# EasyEDA Pro project main_board_shunts.epro

# Schematic Schematic5_1
Board Name: main_board_shunts; Create Date: 2025-07-20; Page Name: P1; Project Name: Aquiles; Schematic Name: Schematic5_1; Update Date: 2025-07-23; Company: Aquiles Corp; Page Size: A4; Version: V1.0
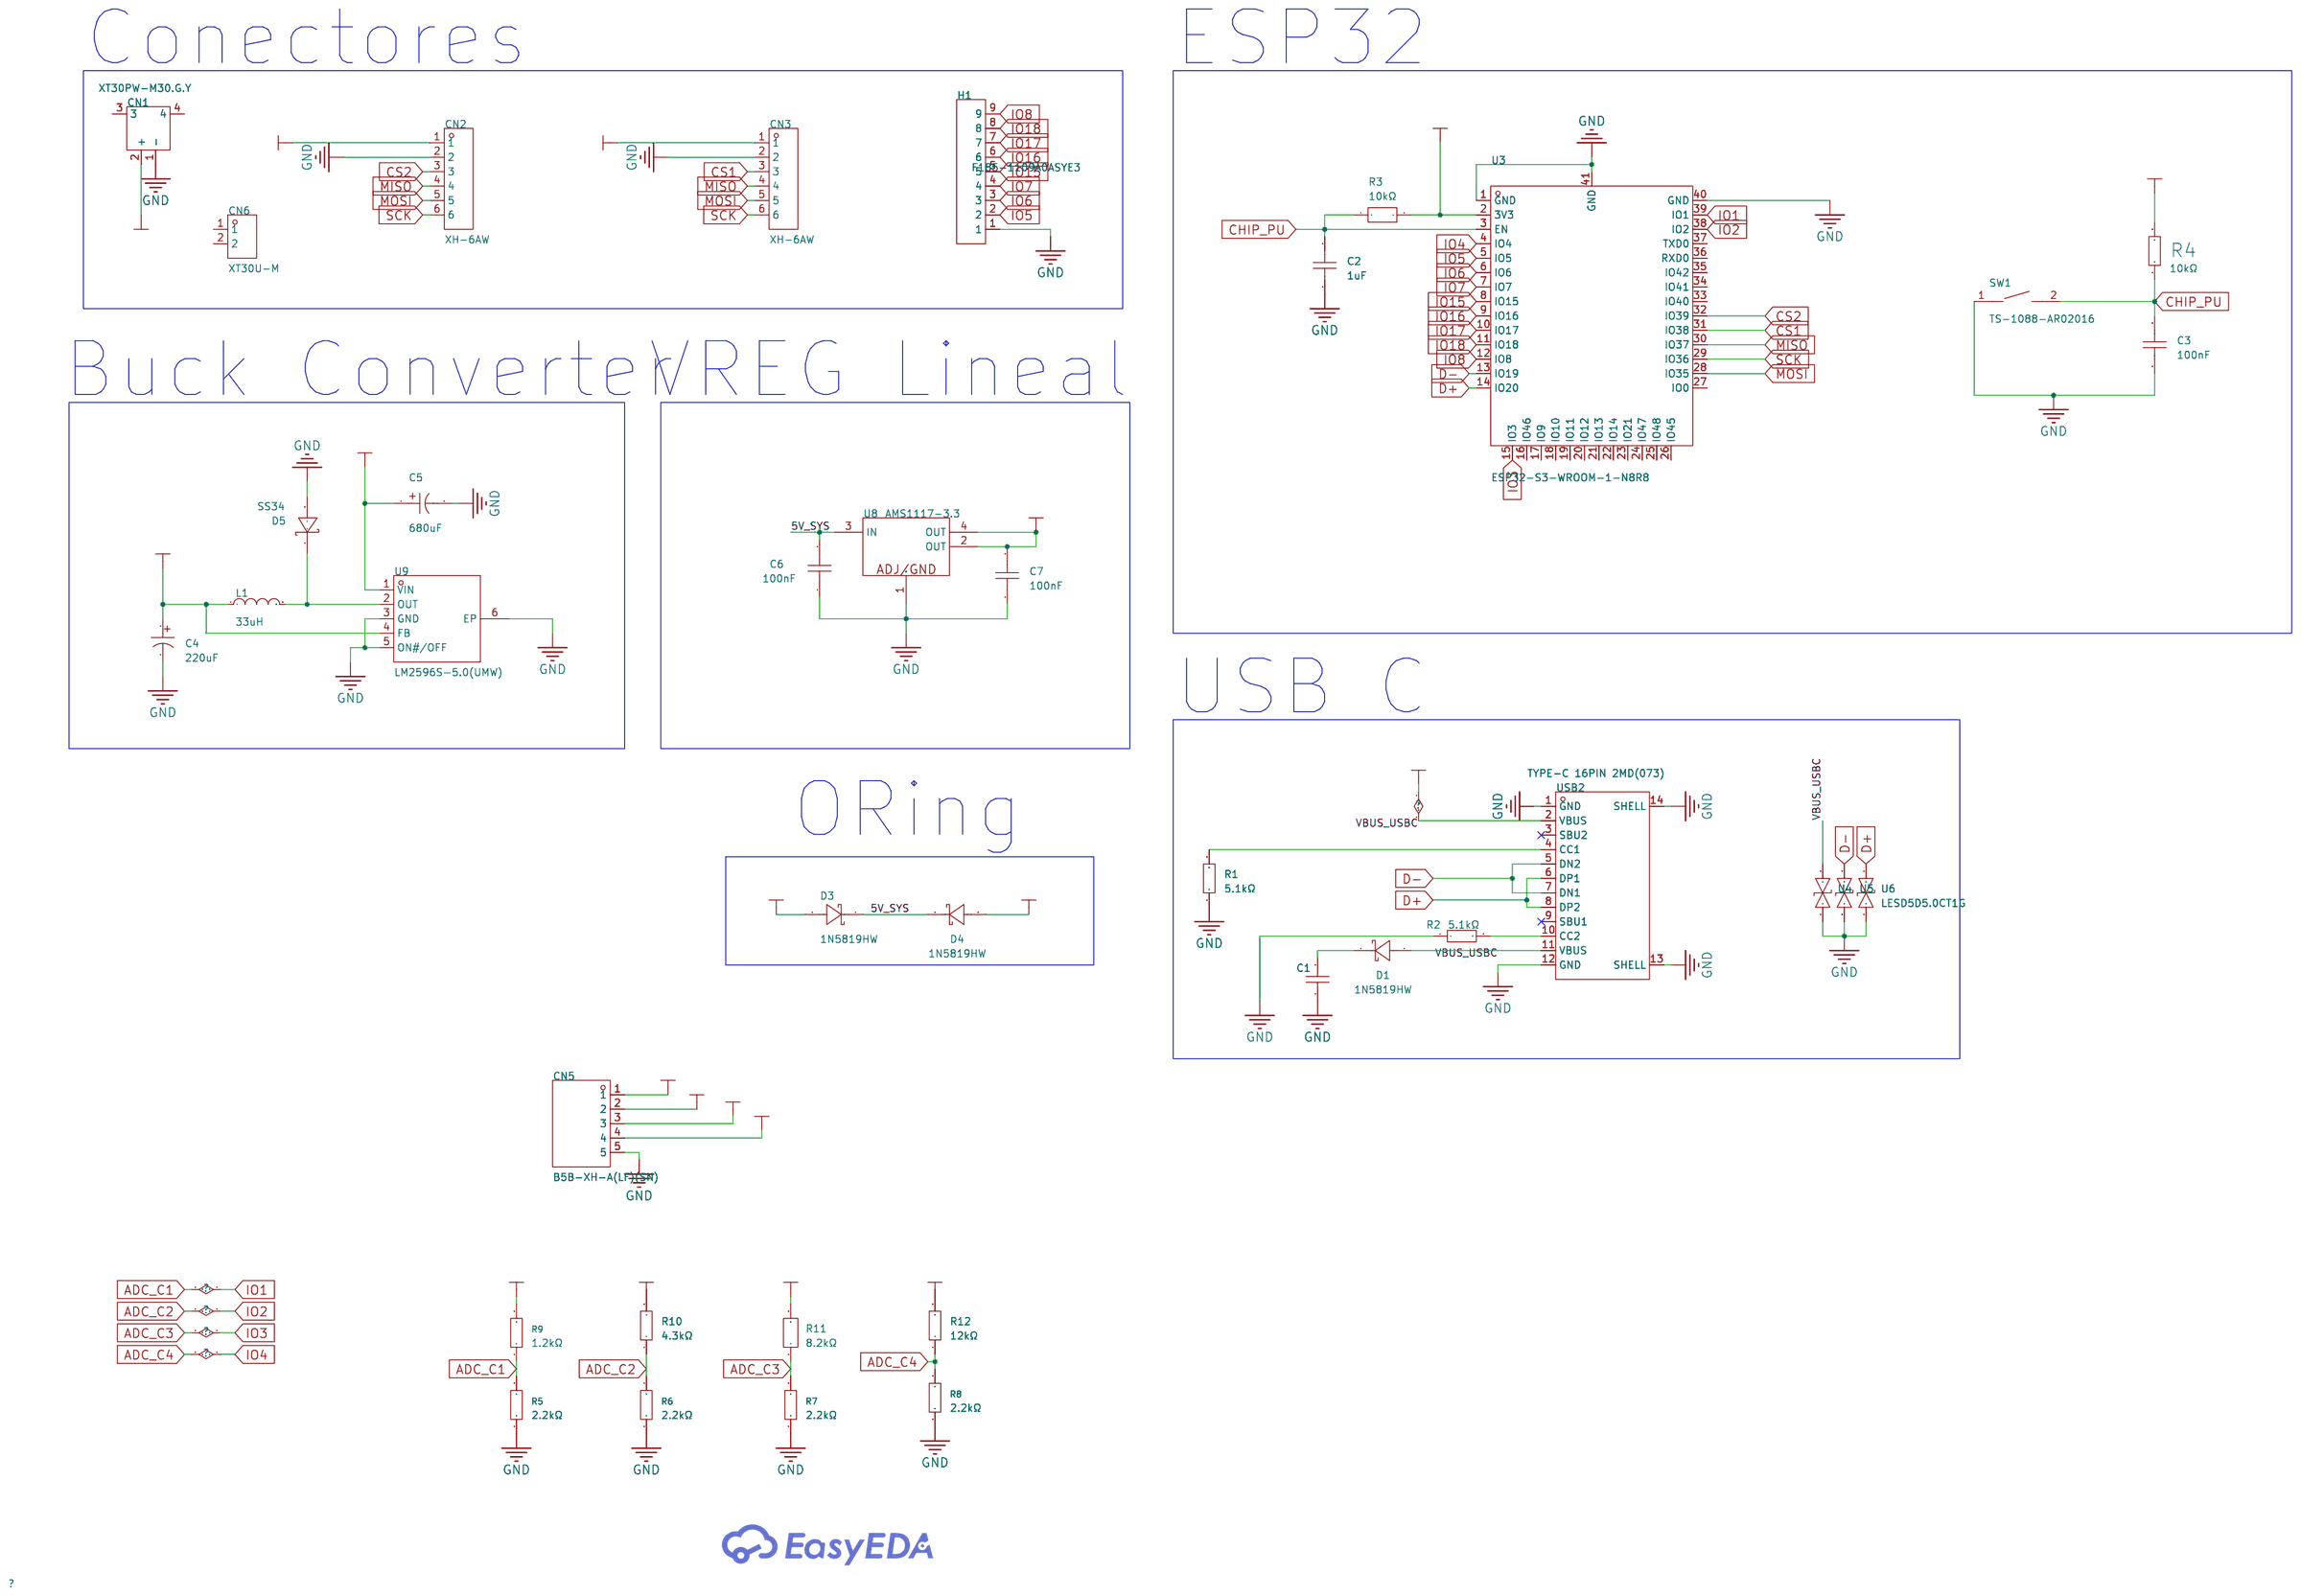
[diagram p0: schematic sheet]

## Parts
C1  10uF  [C0805]
C2  1uF  [C0603]
C3  100nF  [C0603]
C4  220uF  [CAP-SMD_BD6.3-L6.6-W6.6-FD]
C5  680uF  [CAP-SMD_BD6.3-L6.6-W6.6-LS7.0-FD]
C6  100nF  [C0805]
C7  100nF  [C0805]
CN1  XT30PW-M30.G.Y  [CONN-TH_XT30PW-M]
CN2  XH-6AW  [CONN-TH_6P-P2.54_HCTL_XH-6AW_C2908615]
CN3  XH-6AW  [CONN-TH_6P-P2.54_HCTL_XH-6AW_C2908615]
CN5  B5B-XH-A(LF)(SN)  [CONN-TH_B5B-XH-A-LF-SN]
CN6  XT30U-M  [CONN-TH_XT30U-M]
D1  1N5819HW  [SOD-123_L2.7-W1.6-LS3.8-RD]
D3  1N5819HW  [SOD-123_L2.7-W1.6-LS3.8-RD]
D4  1N5819HW  [SOD-123_L2.7-W1.6-LS3.8-RD]
D5  SS34  [SMA_L4.3-W2.6-LS5.2-RD]
H1  F185-1109A0ASYE3  [HDR-TH_9P-P2.54-V-F-1]
L1  33uH  [IND-SMD_L7.0-W6.6_FXL0650]
R1  5.1kΩ  [R0603]
R2  5.1kΩ  [R0603]
R3  10kΩ  [R0603]
R4  10kΩ  [R0603]
R5  2.2kΩ  [R0603]
R6  2.2kΩ  [R0603]
R7  2.2kΩ  [R0603]
R8  2.2kΩ  [R0603]
R9  1.2kΩ  [R0603]
R10  4.3kΩ  [R0603]
R11  8.2kΩ  [R0603]
R12  12kΩ  [R0603]
SW1  TS-1088-AR02016  [SW-SMD_L3.9-W3.0-P4.45]
U3  ESP32-S3-WROOM-1-N8R8  [WIRELM-SMD_ESP32-S3-WROOM-1]
U4  LESD5D5.0CT1G  [SOD-523_L1.2-W0.8-LS1.6-BI]
U5  LESD5D5.0CT1G  [SOD-523_L1.2-W0.8-LS1.6-BI]
U6  LESD5D5.0CT1G  [SOD-523_L1.2-W0.8-LS1.6-BI]
U8  AMS1117-3.3  [SOT-223-3_L6.4-W3.5-P2.30-LS7.0-BR]
U9  LM2596S-5.0(UMW)  [TO-263-5_L10.2-W8.9-P1.70-BR]
USB2  TYPE-C 16PIN 2MD(073)  [USB-C-SMD_TYPE-C-6PIN-2MD-073]

## Library data of the parts
C1 = CL21A106KOQNNNE: Capacitance: Tolerance:±10% Tolerance:±10% Voltage Rated: Temperature Coefficient:; LCSC Part Name: 10uF ±10% 16V; Supplier Part: C1713; Manufacturer: SAMSUNG(三星); Supplier Footprint: 0805; JLCPCB Part Class: Extended Part; Datasheet: https://atta.szlcsc.com/upload/public/pdf/source/20160218/1457707763339.pdf; Supplier: LCSC; Tolerance: ±10%
C2 = CL10A105KB8NNNC: Capacitance: Tolerance:±10% Tolerance:±10% Voltage Rated: Temperature Coefficient:; LCSC Part Name: 1uF ±10% 50V; Supplier Part: C15849; Manufacturer: SAMSUNG(三星); Supplier Footprint: 0603; JLCPCB Part Class: Basic Part; Datasheet: https://atta.szlcsc.com/upload/public/pdf/source/20160218/1457707763339.pdf; Supplier: LCSC; Tolerance: ±10%
C3 = CC0603KRX7R9BB104: Capacitance:100nF Tolerance:±10% Tolerance:±10% Voltage Rating:50V Temperature Coefficient:X7R; LCSC Part Name: 100nF ±10% 50V; Supplier Part: C14663; Manufacturer: YAGEO(国巨); Supplier Footprint: 0603; JLCPCB Part Class: Basic Part; Datasheet: https://atta.szlcsc.com/upload/public/pdf/source/20180910/C282072_33301C7F631E79921B82A8DAC6BCC5B3.pdf; Supplier: LCSC; Tolerance: ±10%; Voltage Rating: 50V; Temperature Coefficient: X7R
C4 = RVT1A221M0605_C72494: Capacitance:220uF Tolerance:±20% Tolerance:±20% Voltage Rating:10V Ripple Current:90mA@120Hz Equivalent Series Resistance(ESR):- Diameter:6.3mm Height - Seated (Max):5.4mm Lifetime:2000hrs@105℃ Operating Temperature:-40℃~+105℃ Operating Temperature:-40℃~+; LCSC Part Name: 220uF ±20% 10V; Supplier Part: C72494; Manufacturer: ROQANG(容强); Manufacturer Part: RVT1A221M0605; Supplier Footprint: SMD,D6.3xL5.4mm; JLCPCB Part Class: Extended Part; Datasheet: https://atta.szlcsc.com/upload/public/pdf/source/20170325/1490427950282.pdf; Supplier: LCSC; Tolerance: ±20%; Voltage Rating: 10V; Ripple Current: 90mA@120Hz; Diameter: 6.3mm; Height - Seated (Max): 5.4mm; Lifetime: 2000hrs@105℃; Operating Temperature: -40℃~+105℃
C5 = GVM0J687M0608CN: Capacitance:680uF Tolerance:±20% Tolerance:±20% Voltage Rating:6.3V Ripple Current:600mA@100kHz; LCSC Part Name: 680uF ±20% 6.3V; Supplier Part: C22383502; Manufacturer: ACMECON(鼎容); Supplier Footprint: SMD,D6.3xL7.7mm; JLCPCB Part Class: Extended Part; Datasheet: https://atta.szlcsc.com/upload/public/pdf/source/20240416/7BE02A688EFD4A45A978C00AE6AEA61D.pdf; Supplier: LCSC; Tolerance: ±20%; Voltage Rating: 6.3V; Ripple Current: 600mA@100kHz
C6 C7 = CC0805KRX7R9BB104: Capacitance: Tolerance:±10% Tolerance:±10% Voltage Rated: Temperature Coefficient:; LCSC Part Name: 100nF ±10% 50V; Supplier Part: C49678; Manufacturer: YAGEO(国巨); Supplier Footprint: 0805; JLCPCB Part Class: Basic Part; Datasheet: https://atta.szlcsc.com/upload/public/pdf/source/20180224/C181747_15194369449651363981.pdf; Supplier: LCSC; Tolerance: ±10%
CN1 = XT30PW-M30.G.Y: Power:- Output:- Input:- Size:- Interface:- Type:- Colour:- MaximumCurrent:- Type:Aviation model plug RatedVoltage:DC 500V Type1:- NumberOfUSBHoles:- InterfaceType:Male MetalMaterial:- InsulationMaterial:- RatedCurrent:15A RecommendedWireGauge:16/18/20AWG; LCSC Part Name: AMASS(艾迈斯)航模插头 卧式弯脚 XT30PW-M公头; Supplier Part: C431092; Manufacturer: AMASS(艾迈斯); JLCPCB Part Class: Extended Part; Datasheet: https://atta.szlcsc.com/upload/public/pdf/source/20220222/6A9F22F7850E25B33E1BE430ADF8560B.pdf; Supplier: LCSC; Type: Aviation model plug; RatedVoltage: DC 500V; InterfaceType: Male; RatedCurrent: 15A; RecommendedWireGauge: 16/18/20AWG; contact resistance: 1.2mΩ; specifications: 2pin
CN2 CN3 = XH-6AW: Pins Structure:1x6P Pitch:2.5mm Mounting Style:Right-Angle Reference Series:XH Number of Pins:6P Number of Rows:1 Number of PINs Per Row:6 Row Spacing:- Current Rating (Max):3A Contact Material:Brass Contact Plating:Tin Operating Temperature Range:-25℃~+8; LCSC Part Name: 1x6P 间距:2.5mm 弯插 系列:XH; Supplier Part: C2908615; Manufacturer: HCTL(华灿天禄); Supplier Footprint: 弯插,P=2.5mm; JLCPCB Part Class: Extended Part; Datasheet: https://atta.szlcsc.com/upload/public/pdf/source/20230711/B565BAF3B11666EF6B81B3605408F2BD.pdf; Supplier: LCSC; Pins Structure: 1x6P; Pitch: 2.5mm; Mounting Style: Right-Angle; Reference Series: XH; Number of Pins: 6P; Number of Rows: 1; Number of PINs Per Row: 6; Current Rating (Max): 3A; Contact Material: Brass; Contact Plating: Tin; Operating Temperature Range: -25℃~+85℃
CN5 = B5B-XH-A(LF)(SN): Pins Structure:1x5P Pitch:2.5mm Mounting Style:Direct Insert Reference Series:XH Number of Pins:5P Number of Rows:1 Number of PINs Per Row:5 Row Spacing:- Current Rating (Max):3A Contact Material:Brass Contact Plating:Tin Operating Temperature Range:-25℃~; LCSC Part Name: 1x5P 间距:2.5mm 直插 系列:XH; Supplier Part: C157991; Manufacturer: JST; Supplier Footprint: 插件,P=2.5mm; JLCPCB Part Class: Extended Part; Datasheet: https://atta.szlcsc.com/upload/public/pdf/source/20180928/C265283_F9DFEEBDB2CF642B6BDFAB4B77BD2680.pdf; Supplier: LCSC; Pins Structure: 1x5P; Pitch: 2.5mm; Mounting Style: Direct Insert; Reference Series: XH; Number of Pins: 5P; Number of Rows: 1; Number of PINs Per Row: 5; Current Rating (Max): 3A; Contact Material: Brass; Contact Plating: Tin; Operating Temperature Range: -25℃~+85℃; Rated Voltage (Max): 250V; Plastic Material: PA66; Flame Retardant Rating: UL94V-0; Supplementary Features: K-leg punch; Colour: White; Z-Height of the Board: 7mm; X-Length of Bottom Edge on Board (Spacing Line): 14.9mm; Y-Width of Bottom Edge on Board: 5.75mm
CN6 = XT30U-M: Power:- Output:- Input:- Size:- Interface:- Type:- Colour:Yellow MaximumCurrent:- Type:Plug RatedVoltage:- Type1:- NumberOfUSBHoles:- InterfaceType:Male MetalMaterial:- InsulationMaterial:- RatedCurrent:- RecommendedWireGauge:- FlameRetardantGrade:- conta; LCSC Part Name: AMASS(艾迈斯)轻量版锂电池插头公头 XT30U-M; Supplier Part: C99101; Manufacturer: AMASS(艾迈斯); JLCPCB Part Class: Extended Part; Datasheet: https://atta.szlcsc.com/upload/public/pdf/source/20170606/1496716542582.pdf; Supplier: LCSC; Type: Plug; Colour: Yellow; InterfaceType: Male
D1 D3 D4 = 1N5819HW_C41431974: Voltage - Forward(Vf@If):0.58V@1.0A Voltage - DC Reverse(Vr):40V Current - Rectified:1A Reverse Leakage Current (Ir):50uA@40V; Supplier Part: C41431974; Manufacturer: GOODWORK(固得沃克); Supplier Footprint: SOD-123; JLCPCB Part Class: Extended Part; Datasheet: https://atta.szlcsc.com/upload/public/pdf/source/20241016/F9575ED4EB339D9C6D56946D8A9F6336.pdf; Supplier: LCSC; Voltage - Forward(Vf@If): 0.58V@1.0A; Voltage - DC Reverse(Vr): 40V; Current - Rectified: 1A; Reverse Leakage Current (Ir): 50uA@40V
D5 = SS34_C8678: Diode Configuration:Independent Type Forward Voltage (Vf@If):550mV@3A Reverse Voltage (Vr):40V Rectified Current:3A Reverse Leakage Current (Ir):500uA@40V; LCSC Part Name: 电压:40V 电流:3A; Supplier Part: C8678; Manufacturer: MDD(辰达半导体); Supplier Footprint: SMA(DO-214AC); JLCPCB Part Class: Basic Part; Datasheet: https://atta.szlcsc.com/upload/public/pdf/source/20240710/2118BB86FDDB2E0B294389AC1F3F65C8.pdf; Supplier: LCSC; Diode Configuration: Independent Type; Forward Voltage (Vf@If): 550mV@3A; Reverse Voltage (Vr): 40V; Rectified Current: 3A; Reverse Leakage Current (Ir): 500uA@40V
H1 = F185-1109A0ASYE3: Holes Structure:1x9P Pitch:2.54mm Mounting Type:Straight Number of Rows:Single Row Number of Positions:9P Insulation Height:8.5mm Contact Material:Brass; LCSC Part Name: 1x9P 间距:2.54mm 直插; Supplier Part: C7494789; Manufacturer: Yxcon(宇熙精密); Supplier Footprint: 插件,P=2.54mm; JLCPCB Part Class: Extended Part; Supplier: LCSC; Holes Structure: 1x9P; Pitch: 2.54mm; Mounting Type: Straight; Number of Rows: Single Row; Number of Positions: 9P; Insulation Height: 8.5mm; Contact Material: Brass
L1 = FXL0650-330-M: Inductance: Tolerance:±20% Tolerance:±20% Rated Current: Saturation Current (Isat):3A DC Resistance (DCR): Type:Integrated molded inductor; LCSC Part Name: 33uH ±20% 3A; Supplier Part: C475526; Manufacturer: cjiang(长江微电); Supplier Footprint: SMD,6.6x7mm; JLCPCB Part Class: Extended Part; Datasheet: https://atta.szlcsc.com/upload/public/pdf/source/20240426/3189EA8206330E2108542F9E34E540E7.pdf; Supplier: LCSC; Tolerance: ±20%; Saturation Current (Isat): 3A; Type: Integrated molded inductor
R1 R2 = 0603WAF5101T5E: Type:Thick Film Resistors Resistance:5.1kΩ Tolerance:±1% Tolerance:±1% Power(Watts): Overload Voltage (Max): Temperature Coefficient:±100ppm/℃ Temperature Coefficient:±100ppm/℃ Operating Temperature Range:-55℃~+155℃ Operating Temperature Range:-55℃~+155℃; LCSC Part Name: 5.1kΩ ±1% 100mW 厚膜电阻; Supplier Part: C23186; Manufacturer: UNI-ROYAL(厚声); Supplier Footprint: 0603; JLCPCB Part Class: Basic Part; Datasheet: https://atta.szlcsc.com/upload/public/pdf/source/20200306/C422600_1E6D84923E4A46A82E41ADD87F860B5C.pdf; Supplier: LCSC; Type: Thick Film Resistors; Tolerance: ±1%; Temperature Coefficient: ±100ppm/℃; Operating Temperature Range: -55℃~+155℃
R3 = SCR0603J10K: Type:Thick Film Resistors Resistance: Tolerance:±5% Tolerance:±5% Power(Watts): Overload Voltage (Max): Operating Temperature Range:-55℃~+155℃ Operating Temperature Range:-55℃~+155℃; LCSC Part Name: 厚膜电阻 10kΩ ±5% 100mW; Supplier Part: C3017715; Manufacturer: VO(翔胜); Supplier Footprint: 0603; JLCPCB Part Class: Extended Part; Datasheet: https://atta.szlcsc.com/upload/public/pdf/source/20220513/247AF9639BA21CF93567DC289CCC6A22.pdf; Supplier: LCSC; Type: Thick Film Resistors; Tolerance: ±5%; Operating Temperature Range: -55℃~+155℃
R4 = 0603WAF1002T5E: Type:Thick Film Resistor Resistance:10kΩ Tolerance:±1% Tolerance:±1% Power(Watts):100mW Voltage-Supply(Max):75V Temperature Coefficient:±100ppm/℃ Temperature Coefficient:±100ppm/℃ Operating Temperature:-55℃~+155℃ Operating Temperature:-55℃~+155℃; LCSC Part Name: 厚膜电阻 10kΩ ±1% 100mW; Supplier Part: C25804; Manufacturer: UNI-ROYAL(厚声); Supplier Footprint: 0603; JLCPCB Part Class: Basic Part; Datasheet: https://atta.szlcsc.com/upload/public/pdf/source/20200306/C422600_1E6D84923E4A46A82E41ADD87F860B5C.pdf; Supplier: LCSC; Type: Thick Film Resistor; Tolerance: ±1%; Power(Watts): 100mW; Voltage-Supply(Max): 75V; Temperature Coefficient: ±100ppm/℃; Operating Temperature: -55℃~+155℃
R5-R8 = RMC06032.2K1%N: Resistance:2.2kΩ Tolerance:±1% Tolerance:±1% Power(Watts):0.1W; LCSC Part Name: 2.2kΩ ±1% 100mW; Supplier Part: C325591; Manufacturer: Tyohm(幸亚电阻); Supplier Footprint: 0603; JLCPCB Part Class: Extended Part; Datasheet: https://atta.szlcsc.com/upload/public/pdf/source/20190115/C325956_D27151D492FFB3C9AB4A6F14FE01F30A.pdf; Supplier: LCSC; Tolerance: ±1%; Power(Watts): 0.1W
R9 = RMC06031.2K5%N: Resistance: Tolerance:±5% Tolerance:±5% Power(Watts):; LCSC Part Name: 1.2kΩ ±5% 100mW; Supplier Part: C269681; Manufacturer: Tyohm(幸亚电阻); Supplier Footprint: 0603; JLCPCB Part Class: Extended Part; Datasheet: https://atta.szlcsc.com/upload/public/pdf/source/20190115/C325956_D27151D492FFB3C9AB4A6F14FE01F30A.pdf; Supplier: LCSC; Tolerance: ±5%
R10 = 0603WAF4301T5E: Type:Thick Film Resistors Resistance:4.3kΩ Tolerance:±1% Tolerance:±1% Power(Watts): Overload Voltage (Max): Temperature Coefficient:±100ppm/℃ Temperature Coefficient:±100ppm/℃ Operating Temperature Range:-55℃~+155℃ Operating Temperature Range:-55℃~+155℃; LCSC Part Name: 4.3kΩ ±1% 100mW 厚膜电阻; Supplier Part: C23159; Manufacturer: UNI-ROYAL(厚声); Supplier Footprint: 0603; JLCPCB Part Class: Extended Part; Datasheet: https://atta.szlcsc.com/upload/public/pdf/source/20200306/C422600_1E6D84923E4A46A82E41ADD87F860B5C.pdf; Supplier: LCSC; Type: Thick Film Resistors; Tolerance: ±1%; Temperature Coefficient: ±100ppm/℃; Operating Temperature Range: -55℃~+155℃
R11 = FRC0603F8201TS: Type:Thick Film Resistors Resistance:8.2kΩ Tolerance:±1% Tolerance:±1% Power(Watts): Voltage-Supply(Max): Temperature Coefficient:±100ppm/℃ Temperature Coefficient:±100ppm/℃ Operating Temperature:-55℃~+155℃ Operating Temperature:-55℃~+155℃; LCSC Part Name: 8.2kΩ ±1% 100mW 厚膜电阻; Supplier Part: C2907069; Manufacturer: FOJAN(富捷); Supplier Footprint: 0603; JLCPCB Part Class: Extended Part; Datasheet: https://atta.szlcsc.com/upload/public/pdf/source/20211221/925EC7D7225764EE0046F22065062C87.pdf; Supplier: LCSC; Type: Thick Film Resistors; Tolerance: ±1%; Temperature Coefficient: ±100ppm/℃; Operating Temperature: -55℃~+155℃
R12 = 0603WAF1202T5E: Type:Thick Film Resistors Resistance:12kΩ Tolerance:±1% Tolerance:±1% Power(Watts): Overload Voltage (Max): Temperature Coefficient:±100ppm/℃ Temperature Coefficient:±100ppm/℃ Operating Temperature Range:-55℃~+155℃ Operating Temperature Range:-55℃~+155℃; LCSC Part Name: 12kΩ ±1% 100mW 厚膜电阻; Supplier Part: C22790; Manufacturer: UNI-ROYAL(厚声); Supplier Footprint: 0603; JLCPCB Part Class: Basic Part; Datasheet: https://atta.szlcsc.com/upload/public/pdf/source/20200306/C422600_1E6D84923E4A46A82E41ADD87F860B5C.pdf; Supplier: LCSC; Type: Thick Film Resistors; Tolerance: ±1%; Temperature Coefficient: ±100ppm/℃; Operating Temperature Range: -55℃~+155℃
SW1 = TS-1088-AR02016: Circuit:SPST Actuator Style:Round Button Operating Force:160gf Mounting Style:Brick nogging Switch Length:4mm Switch Width:3mm Switch Height:2mm Strike Gundam:不带 Contact Current:50mA Voltage Rating (DC):12V Insulation Resistance:100MΩ Actuator/Cap Color:B; LCSC Part Name: 4*3*2mm 立贴 轻触开关; Supplier Part: C720477; Manufacturer: XUNPU(讯普); Supplier Footprint: SMD; JLCPCB Part Class: Basic Part; Datasheet: https://atta.szlcsc.com/upload/public/pdf/source/20200810/C720475_60D09DD6C54279ADDB2DC25100F1CC11.pdf; Supplier: LCSC; Circuit: SPST; Actuator Style: Round Button; Operating Force: 160gf; Mounting Style: Brick nogging; Switch Length: 4mm; Switch Width: 3mm; Switch Height: 2mm; Strike Gundam: 不带; Contact Current: 50mA; Voltage Rating (DC): 12V; Insulation Resistance: 100MΩ; Actuator/Cap Color: Black; Pin Style: SMDSplicing; Mechanical Life: 10万次; Operating Temperature: -30℃~+80℃
U3 = ESP32-S3-WROOM-1-N8R8: Supplier Part: C2913201; Manufacturer: ESPRESSIF(乐鑫); Supplier Footprint: SMD,25.5x18mm; JLCPCB Part Class: Extended Part; Datasheet: https://atta.szlcsc.com/upload/public/pdf/source/20241030/6A412B13087E1327DF6279F5735253CA.pdf; Supplier: LCSC
U4-U6 = LESD5D5.0CT1G_C5246195: Supplier Part: C5246195; Manufacturer: Leiditech(雷卯电子); Supplier Footprint: SOD-523; JLCPCB Part Class: Extended Part; Datasheet: https://atta.szlcsc.com/upload/public/pdf/source/20221108/1C42B36F7D16189BC2911DA9C8277455.pdf; Supplier: LCSC
U8 = AMS1117-3.3: Output Type:Fixed Voltage - Supply:15V Output Voltage:3.3V Output Voltage:3.3V Output Current:1A Power Supply Rejection Ratio (PSRR):- Features:Overcurrent Protection(OCP) Operating Temperature:-40℃~+125℃ Operating Temperature:-40℃~+125℃ Output Configurat; Supplier Part: C2992570; Manufacturer: 国芯佳品; Supplier Footprint: SOT-223-3; JLCPCB Part Class: Extended Part; Datasheet: https://atta.szlcsc.com/upload/public/pdf/source/20220729/0D21C21EC310E4778671BF6BAE438640.pdf; Supplier: LCSC; Output Type: Fixed; Voltage - Supply: 15V; Output Voltage: 3.3V; Output Current: 1A; Features: Overcurrent Protection(OCP); Operating Temperature: -40℃~+125℃; Output Configuration: Positive electrode; Number of Outputs: 1
U9 = LM2596S-5.0(UMW): Function:Step-down type Output Type:Fixed Input Voltage:7V~40V Input Voltage:7V~40V Output Voltage:5V Output Voltage:5V Output Current:3A Switching Frequency:150kHz Switching Frequency:150kHz Operating Temperature:-40℃~+125℃@(TA) Operating Temperature:-40; LCSC Part Name: 3A降压稳压器; Supplier Part: C347421; Manufacturer: UMW(友台半导体); Supplier Footprint: TO-263-5; JLCPCB Part Class: Extended Part; Datasheet: https://atta.szlcsc.com/upload/public/pdf/source/20241113/7515F50B4FEE0270D4DE7078364C87FA.pdf; Supplier: LCSC; Function: Step-down type; Output Type: Fixed; Input Voltage: 7V~40V; Output Voltage: 5V; Output Current: 3A; Switching Frequency: 150kHz; Operating Temperature: -40℃~+125℃@(TA); Synchronous Rectification: No; Number of Outputs: 1; Topology: Step-down; Quiescent Current (Iq): 80uA; Switch tube (built-in/external): Built-in
USB2 = TYPE-C 16PIN 2MD(073): Connector Type:Type-C Protocol Standard:USB 3.1 Gender:Female Mounting Type:Surface Mount, Right Angle Number of Contacts:16P Number of Ports:1 Current Rating-Power:3A Voltage Rating:5V Connect-Disconnect Life:5,000 Cycles Supplementary Features:- Center; LCSC Part Name: Type-C 母 卧贴; Supplier Part: C2765186; Manufacturer: SHOU HAN(首韩); Supplier Footprint: SMD; JLCPCB Part Class: Extended Part; Datasheet: https://atta.szlcsc.com/upload/public/pdf/source/20250506/FFB74EDFDFA0AC372CE4A8E4F739CCEF.pdf; Supplier: LCSC; Connector Type: Type-C; Protocol Standard: USB 3.1; Gender: Female; Mounting Type: Surface Mount, Right Angle; Number of Contacts: 16P; Number of Ports: 1; Current Rating-Power: 3A; Voltage Rating: 5V; Connect-Disconnect Life: 5,000 Cycles; Detection color: Black; Operating Temperature: -25℃~+85℃

## Nets
5V_REG: C4.1 CN2.1 CN3.1 D3.2(A) L1.1 U9.4(FB)
5V_SYS: C6.2 D3.1(C) D4.1(C) U8.3(IN)
5V_USB: D1.2(A) D4.2(A) U4.2 USB2.2(VBUS) USB2.11(VBUS)
GND: C1.1 C2.1 C3.1 C4.2 C5.2 C6.1 C7.1 CN1.1(-) CN2.2 CN3.2 CN5.5 D5.2(A) H1.1 R1.1 R2.1 R5.1 R6.1 R7.1 R8.1 SW1.1 U3.1(GND) U3.40(GND) U3.41(GND) U4.1 U5.1 U6.1 U8.1(ADJ/GND) U9.3(GND) U9.5(ON#/OFF) U9.6(EP) USB2.1(GND) USB2.12(GND) USB2.13(SHELL) USB2.14(SHELL)
ADC_C1: R5.2 R9.1 U3.39(IO1)
ADC_C2: R6.2 R10.1 U3.38(IO2)
ADC_C3: R7.2 R11.1 U3.15(IO3)
ADC_C4: R8.2 R12.1 U3.4(IO4)
CHIP_PU: C2.2 C3.2 R3.1 R4.1 SW1.2 U3.3(EN)
CS1: CN3.3 U3.31(IO38)
CS2: CN2.3 U3.32(IO39)
D+: U3.14(IO20) U6.2 USB2.6(DP1) USB2.8(DP2)
D-: U3.13(IO19) U5.2 USB2.5(DN2) USB2.7(DN1)
IO5: H1.2 U3.5(IO5)
IO6: H1.3 U3.6(IO6)
IO7: H1.4 U3.7(IO7)
IO8: H1.9 U3.12(IO8)
IO15: H1.5 U3.8(IO15)
IO16: H1.6 U3.9(IO16)
IO17: H1.7 U3.10(IO17)
IO18: H1.8 U3.11(IO18)
MISO: CN2.4 CN3.4 U3.30(IO37)
MOSI: CN2.5 CN3.5 U3.28(IO35)
PWR_VCC: C5.1 CN1.2(+) U9.1(VIN)
SCK: CN2.6 CN3.6 U3.29(IO36)
V_C1: CN5.4 R9.2
V_C2: CN5.3 R10.2
V_C3: CN5.2 R11.2
V_C4: CN5.1 R12.2
VSYS: C7.2 R3.2 R4.2 U3.2(3V3) U8.2(OUT) U8.4(OUT)
$1N3095: R1.2 USB2.4(CC1)
$1N3333: C1.2 D1.1(C)
$1N3491: R2.2 USB2.10(CC2)
$1N7879: D5.1(K) L1.2 U9.2(OUT)

Not connected (* = marked no-connect by the designer): CN1 3 4; CN6 1 2; U3 16(IO46) 17(IO9) 18(IO10) 19(IO11) 20(IO12) 21(IO13) 22(IO14) 23(IO21) 24(IO47) 25(IO48) 26(IO45) 27(IO0) 33(IO40) 34(IO41) 35(IO42) 36(RXD0) 37(TXD0); USB2 3(SBU2)* 9(SBU1)*

## Notes on the sheet
- Conectores
- ESP32
- Buck Converter
- VREG Lineal
- USB C
- ORing

# Board PCB7_1
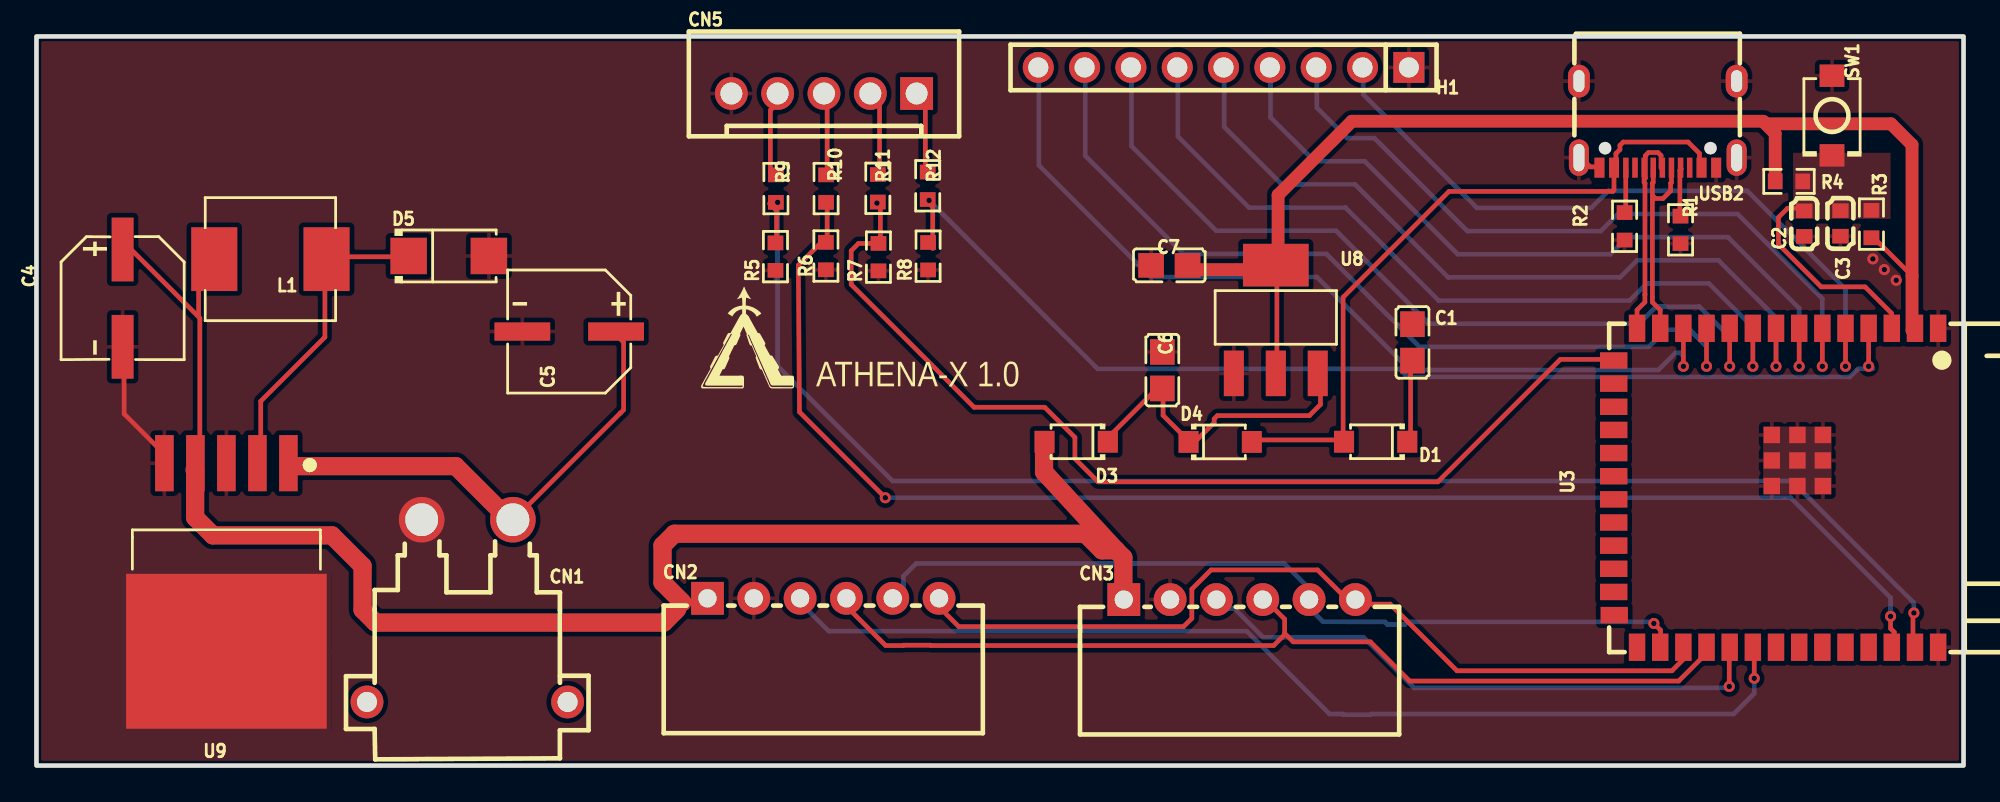
[diagram p1: board, top side]
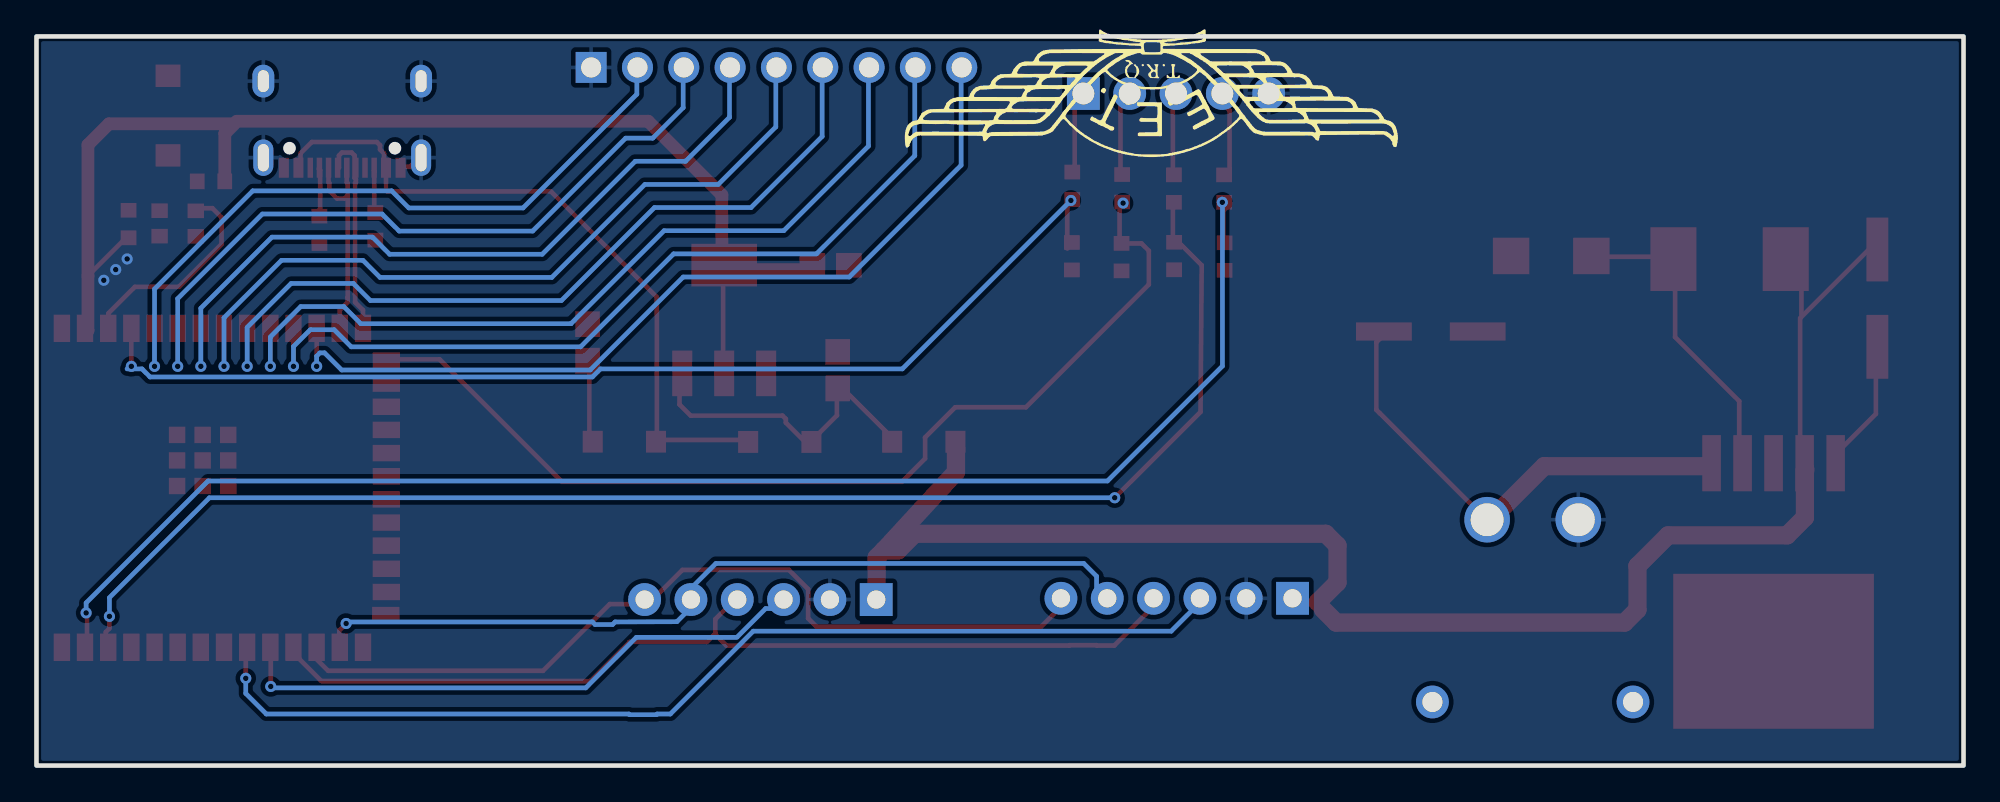
[diagram p2: board, bottom side, seen from below]

Outline 105.66 x 40 mm; copper layers: Top Layer, Bottom Layer. Coordinates in mm from the lower left corner of the outline.
Outline path: rectangle 0,40 105.66,0
Stack: Top Layer 0.035mm / Dielectric1 1.51mm FR4 er 4.5 / Bottom Layer 0.035mm

## Design rules (mm)
net D-: DP1
net D+: DP1
template: JLCPCB Capability(Two Layers Board)
spacing copperThickness1oz (default): track to track 0.102, other pairs 0.152 to 0.3
spacing copperThickness2oz: track to track 0.203, other pairs 0.152 to 0.3
track width copperThickness1oz (default): min 0.127, default 0.254, max 2.54
track width copperThickness2oz: min 0.203, default 0.254, max 2.54
differential pair differentialPair (default): width min 0.127, default 0.254, max 2.54; gap min 0.152, default 0.152
via viaSize (default): diameter min 0.5, default 0.61, max 10; hole min 0.3, default 0.305, max 6.3

## Placement (name value [footprint] x y rotation side)
C1  10uF  [C0805]  75.45 23.22 270 top
C2  1uF  [C0603]  96.93 29.74 90 top
C3  100nF  [C0603]  98.91 29.75 90 top
C4  220uF  [CAP-SMD_BD6.3-L6.6-W6.6-FD]  4.72 25.65 270 top
C5  680uF  [CAP-SMD_BD6.3-L6.6-W6.6-LS7.0-FD]  29.21 23.81 180 top
C6  100nF  [C0805]  61.73 21.69 270 top
C7  100nF  [C0805]  62.12 27.45 0 top
CN1  XT30PW-M30.G.Y  [CONN-TH_XT30PW-M]  23.62 8.49 0 top
CN2  XH-6AW  [CONN-TH_6P-P2.54_HCTL_XH-6AW_C2908615]  43.14 9.18 0 top
CN3  XH-6AW  [CONN-TH_6P-P2.54_HCTL_XH-6AW_C2908615]  65.97 9.11 0 top
CN5  B5B-XH-A(LF)(SN)  [CONN-TH_B5B-XH-A-LF-SN]  43.18 36.88 0 top
D1  1N5819HW  [SOD-123_L2.7-W1.6-LS3.8-RD]  73.43 17.77 180 top
D3  1N5819HW  [SOD-123_L2.7-W1.6-LS3.8-RD]  57.01 17.76 180 top
D4  1N5819HW  [SOD-123_L2.7-W1.6-LS3.8-RD]  64.91 17.76 0 top
D5  SS34  [SMA_L4.3-W2.6-LS5.2-RD]  22.61 27.96 0 top
H1  F185-1109A0ASYE3  [HDR-TH_9P-P2.54-V-F-1]  65.09 38.3 180 top
L1  33uH  [IND-SMD_L7.0-W6.6_FXL0650]  12.83 27.79 180 top
R1  5.1kΩ  [R0603]  90.15 29.39 90 top
R2  5.1kΩ  [R0603]  87.08 29.59 90 top
R3  10kΩ  [R0603]  100.61 29.71 270 top
R4  10kΩ  [R0603]  96.09 32.05 180 top
R5  2.2kΩ  [R0603]  40.52 27.92 90 top
R6  2.2kΩ  [R0603]  43.29 27.96 90 top
R7  2.2kΩ  [R0603]  46.17 27.9 90 top
R8  2.2kΩ  [R0603]  48.89 27.95 90 top
R9  1.2kΩ  [R0603]  40.54 31.66 90 top
R10  4.3kΩ  [R0603]  43.3 31.66 90 top
R11  8.2kΩ  [R0603]  46.13 31.67 90 top
R12  12kΩ  [R0603]  48.87 31.81 90 top
SW1  TS-1088-AR02016  [SW-SMD_L3.9-W3.0-P4.45]  98.45 35.66 270 top
U3  ESP32-S3-WROOM-1-N8R8  [WIRELM-SMD_ESP32-S3-WROOM-1]  95.38 15.24 270 top
U8  AMS1117-3.3  [SOT-223-3_L6.4-W3.5-P2.30-LS7.0-BR]  67.96 24.49 270 top
U9  LM2596S-5.0(UMW)  [TO-263-5_L10.2-W8.9-P1.70-BR]  10.41 11.43 90 top
USB2  TYPE-C 16PIN 2MD(073)  [USB-C-SMD_TYPE-C-6PIN-2MD-073]  88.9 35.18 180 top

## Footprints (pads in the part's own frame, mm; a bottom-side part is the same pattern mirrored in y, then rotated)
C0603
  rect 0.8x0.9 smd: 1(-0.7,0) 2(0.7,0)
C0805
  rect 1.41x1.35 smd: 1(-1,0) 2(1,0)
CAP-SMD_BD6.3-L6.6-W6.6-FD
  rect 3.5x1.2 smd: 1(-2.67,0) 2(2.67,0)
CAP-SMD_BD6.3-L6.6-W6.6-LS7.0-FD
  rect 3.06x1 smd: 1(-2.57,0) 2(2.57,0)
CONN-TH_6P-P2.54_HCTL_XH-6AW_C2908615
  rect 1.8x1.8 hole 1: 1(-6.35,0)
  round 1.8 hole 1: 2(-3.81,0) 3(-1.27,0) 4(1.27,0) 5(3.81,0) 6(6.35,0)
CONN-TH_B5B-XH-A-LF-SN
  rect 1.8x1.8 hole 1.2: 1(5.08,0)
  round 1.8 hole 1.2: 2(2.54,0) 3(0,0) 4(-2.54,0) 5(-5.08,0)
CONN-TH_XT30PW-M
  round 2.5 hole 1.8: 1(-2.5,5) 2(2.5,5)
  round 1.8 hole 1.1: 3(5.5,-5) 4(-5.5,-5)
HDR-TH_9P-P2.54-V-F-1
  rect 1.7x1.7 hole 1.1: 1(-10.16,0)
  round 1.7 hole 1.1: 2(-7.62,0) 3(-5.08,0) 4(-2.54,0) 5(0,0) 6(2.54,0) 7(5.08,0) 8(7.62,0) 9(10.16,0)
IND-SMD_L7.0-W6.6_FXL0650
  rect 2.524x3.5 smd: 1(3.078,0) 2(-3.078,0)
R0603
  rect 0.806x0.864 smd: 1(-0.753,0) 2(0.753,0)
SMA_L4.3-W2.6-LS5.2-RD
  rect 2x2 smd: 1(-2.2,0) 2(2.2,0)
SOD-123_L2.7-W1.6-LS3.8-RD
  rect 1.1x1.2 smd: 1(-1.735,0) 2(1.735,0)
SOT-223-3_L6.4-W3.5-P2.30-LS7.0-BR
  rect 2.5x1.1 smd: 1(2.97,-2.3) 2(2.97,0) 3(2.97,2.3)
  rect 2.34x3.6 smd: 4(-2.97,0)
SW-SMD_L3.9-W3.0-P4.45
  rect 1.23x1.36 smd: 1(-2.185,0) 2(2.185,0)
TO-263-5_L10.2-W8.9-P1.70-BR
  rect 3.083x1.02 smd: 1(5.16,-3.4) 2(5.16,-1.7) 3(5.16,0) 4(5.16,1.7) 5(5.16,3.4)
  rect 8.5x11 smd: 6(-5.16,0)
USB-C-SMD_TYPE-C-6PIN-2MD-073
  rect 0.55x1.1 smd: 1(-3.2,2.375) 2(-2.4,2.375) 11(2.4,2.375) 12(3.2,2.375)
  rect 0.3x1.1 smd: 3(-1.75,2.375) 4(-1.25,2.375) 5(-0.75,2.375) 6(-0.25,2.375) 7(0.25,2.375) 8(0.75,2.375) 9(1.25,2.375) 10(1.75,2.375)
  oval 1.1x2 hole 0.6x1.5: 13(-4.325,1.825) 14(4.325,1.825)
  oval 1.2x1.8 hole 0.6x1.2: 13(-4.325,-2.375) 14(4.325,-2.375)
WIRELM-SMD_ESP32-S3-WROOM-1
  rect 1.5x0.9 smd: 1(-8.75,8.895) 2(-8.75,7.625) 3(-8.75,6.355) 4(-8.75,5.085) 5(-8.75,3.815) 6(-8.75,2.545) 7(-8.75,1.275) 8(-8.75,0.005) 9(-8.75,-1.265) 10(-8.75,-2.535) 11(-8.75,-3.805) 12(-8.75,-5.075) 13(-8.75,-6.345) 14(-8.75,-7.615) 27(8.75,-7.615) 28(8.75,-6.345) 29(8.75,-5.075) 30(8.75,-3.805) 31(8.75,-2.535) 32(8.75,-1.265) 33(8.75,0.005) 34(8.75,1.275) 35(8.75,2.545) 36(8.75,3.815) 37(8.75,5.085) 38(8.75,6.355) 39(8.75,7.625) 40(8.75,8.895)
  rect 0.9x1.5 smd: 15(-6.985,-8.895) 16(-5.715,-8.895) 17(-4.445,-8.895) 18(-3.175,-8.895) 19(-1.905,-8.895) 20(-0.635,-8.895) 21(0.635,-8.895) 22(1.905,-8.895) 23(3.175,-8.895) 24(4.445,-8.895) 25(5.715,-8.895) 26(6.985,-8.865)
  rect 0.9x0.9 smd: 41(-2.9,2.575) 41(-2.9,1.175) 41(-2.9,-0.225) 41(-1.5,2.575) 41(-1.5,1.175) 41(-1.5,-0.225) 41(-0.1,2.575) 41(-0.1,1.175) 41(-0.1,-0.225)

## Nets
As in the schematic.

Pads without a net: CN1 3 4; U3 16 17 18 19 20 21 22 23 24 25 26 27 33 34 35 36 37; USB2 3 9

## Via types
v1: diameter 0.61, hole 0.305, Top Layer to Bottom Layer, 21 vias

## Routing (per net, layer and track width the routed paths; a pad name or vN(x,y) marks a point on that pad's centre or on a via; arc(x,y) is an arc through that point)
5V_REG: length 88.8
  Top Layer w0.254: 8.96,16.87 8.96,24.55 4.95,28.56 ; 10.29,27.56 8.89,26.16 8.89,24.7
  Top Layer w1: 59.2,11.81 58.42,11.81 57.52,12.72 34.97,12.72 34.33,12.07 34.33,10.05 35.42,8.96 ; 59.2,11.81 55.25,16.1 55.25,17.43 ; 59.2,11.81 59.59,11.41 59.59,9.56 59.42,9.39 ; 8.67,16.22 8.7,16.19 8.7,13.61 9.68,12.63 16.2,12.63 17.88,10.95 17.88,8.55 18.59,7.84 34.4,7.84 35.13,8.58
5V_SYS: length 18.2
  Top Layer w0.254: 63.26,17.5 63.37,17.61 ; 63.37,17.61 61.77,19.21 61.77,20.71 ; 63.37,17.61 64.58,18.81 64.58,19.02 64.76,19.2 69.79,19.2 70.4,19.81 70.4,21.1 ; 63.37,17.61 63.48,17.51 ; 58.67,17.46 58.67,17.91 61.72,20.96
5V_USB: length 37.2
  Top Layer w0.254: 66.58,17.87 71.45,17.87 ; 86.61,33.25 86.61,33.58 86.83,33.8 86.83,34.03 87.01,34.21 90.56,34.21 91.19,33.59 91.19,33.18 91.31,33.06 ; 86.5,32.44 86.5,31.57 86.43,31.5 77.45,31.5 71.65,25.69 71.65,17.75 71.58,17.68
GND: length 7.3
  Top Layer w0.254: 85.78,32.85 85.2,32.85 84.79,33.26 ; 7.11,16.99 4.8,19.3 4.8,22.2
  vias: v1(100.69,27.8) v1(101.32,27.21) v1(101.97,26.63)
ADC_C1: length 81.1
  Top Layer w0.254: 40.19,30.83 40.58,30.45 40.58,28.8 ; v1(102.94,8.38) 102.94,8.29 102.89,8.24 102.89,6.79 102.94,6.74
  Bottom Layer w0.254: 40.59,30.9 40.64,30.85 40.64,21.92 46.94,15.61 96.25,15.61 102.94,8.93 v1(102.94,8.38)
  vias: v1(40.64,30.9)
ADC_C2: length 79
  Top Layer w0.254: 43.26,28.94 41.77,27.45 41.84,19.4 v1(46.54,14.69) ; 101.86,6.71 101.86,7.32 101.66,7.52 v1(101.66,8.19) ; 43.35,28.75 43.35,30.76 43.23,30.88
  Bottom Layer w0.254: v1(101.66,8.19) 101.66,9.21 96.18,14.69 v1(46.54,14.69)
ADC_C3: length 55.7
  Top Layer w0.254: 46.03,30.93 46.27,30.69 46.27,28.61 ; 46,28.65 45.07,28.65 44.67,28.25 44.67,26.4 51.41,19.66 55.28,19.66 56.94,18 56.94,16.84 58.21,15.57 76.84,15.57 83.56,22.29 86.56,22.29 86.6,22.25
  vias: v1(46.08,30.86)
ADC_C4: length 60.7
  Top Layer w0.254: U3.4 v1(100.46,21.9) ; 48.91,30.88 49.15,30.64 49.15,28.37 ; v1(48.94,31.01) 48.92,31.01
  Bottom Layer w0.254: v1(48.94,31.01) 58.19,21.76 74.74,21.76 75.18,21.32 99.43,21.32 99.88,21.76 100.7,21.76
CHIP_PU: length 12
  Top Layer w0.254: 101.7,23.74 101.72,23.76 101.72,24.82 100.27,26.26 97.86,26.26 95.52,28.61 95.52,30.08 96.02,30.58 96.97,30.58
CS1: length 31.9
  Top Layer w0.254: 92.58,6.37 92.82,6.13 v1(92.82,4.34)
  Bottom Layer w0.254: 67.25,7.03 72.77,7.03 75.55,4.26 92.74,4.26 v1(92.82,4.34) ; 67.22,7.07 65.68,8.61 64.88,8.61
CS2: length 58.2
  Top Layer w0.254: 94.11,6.46 94.19,6.39 v1(94.19,4.79)
  Bottom Layer w0.254: v1(94.19,4.79) 94.19,3.96 93.06,2.83 73.18,2.83 73.14,2.79 71.67,2.79 71.63,2.83 70.91,2.83 66.36,7.37 43.44,7.37 42.23,8.58 41.45,8.58
D+: length 11.4
  Top Layer w0.254: USB2.6 89.08,32.8 89.08,33.47 88.92,33.63 88.38,33.63 88.22,33.47 88.22,32.24 88.15,32.17 88.15,32 88.2,31.95 88.2,25.85 88.19,25.85 88.19,25.43 87.76,24.99 U3.14
D-: length 11.6
  Top Layer w0.254: 88.6,31.28 88.77,31.11 89.19,31.11 89.6,31.53 89.6,31.95 89.65,32 USB2.5 ; 88.6,31.28 88.6,31.95 88.65,32 USB2.7 ; 88.6,31.28 88.6,25.68 88.6,25.68 88.6,25.43 89.03,24.99 U3.13
IO5: length 39.4
  Top Layer w0.254: U3.5 v1(99.19,21.9)
  Bottom Layer w0.254: 72.74,38.25 72.74,36.83 78.98,30.59 85.25,30.59 86.19,31.53 93.8,31.53 99.19,26.15 v1(99.19,21.9)
IO6: length 40.8
  Top Layer w0.254: U3.6 v1(97.92,21.9)
  Bottom Layer w0.254: 70.2,38.25 70.2,36.09 71.87,34.43 73.36,34.43 78.46,29.32 85.77,29.32 86.71,30.26 93.28,30.26 97.92,25.62 v1(97.92,21.9)
IO7: length 42.1
  Top Layer w0.254: U3.7 v1(96.65,21.9)
  Bottom Layer w0.254: 67.66,38.25 67.66,35.57 70.08,33.16 72.83,33.16 77.93,28.05 86.3,28.05 87.24,28.99 92.75,28.99 96.65,25.09 v1(96.65,21.9)
IO8: length 48.4
  Top Layer w0.254: U3.12 v1(90.3,21.9)
  Bottom Layer w0.254: v1(90.3,21.9) 90.3,22.46 90.12,22.64 89.87,22.64 88.93,21.7 75.3,21.7 70.2,26.81 61.1,26.81 54.96,32.94 54.96,38.25
IO15: length 43.3
  Top Layer w0.254: U3.8 v1(95.38,21.9)
  Bottom Layer w0.254: v1(95.38,21.9) 95.38,24.57 92.23,27.72 87.76,27.72 86.83,26.78 77.41,26.78 72.3,31.89 68.28,31.89 65.12,35.04 65.12,38.25
IO16: length 44.6
  Top Layer w0.254: U3.9 v1(94.11,21.9)
  Bottom Layer w0.254: 62.58,38.25 62.58,34.52 66.48,30.62 71.78,30.62 76.88,25.51 87.35,25.51 88.29,26.45 91.7,26.45 94.11,24.04 v1(94.11,21.9)
IO17: length 45.9
  Top Layer w0.254: U3.10 v1(92.84,21.9)
  Bottom Layer w0.254: v1(92.84,21.9) 92.84,23.52 91.17,25.18 88.82,25.18 87.88,24.24 76.35,24.24 71.25,29.35 64.69,29.35 60.04,33.99 60.04,38.25
IO18: length 47.1
  Top Layer w0.254: U3.11 v1(91.57,21.9)
  Bottom Layer w0.254: v1(91.57,21.9) 91.57,22.99 90.65,23.91 89.34,23.91 88.4,22.97 75.83,22.97 70.73,28.08 62.89,28.08 57.5,33.46 57.5,38.25
MISO: length 52.3
  Top Layer w0.254: 44.11,9.04 46.56,6.59 47.52,6.59 47.54,6.6 49.01,6.6 49.03,6.59 67.84,6.59 68.44,7.19 68.44,8.03 67.56,8.91 ; 91.44,5.93 91.34,5.93 90.04,4.63 75.29,4.63 73.14,6.79 68.91,6.79 68.44,7.25
MOSI: length 44.5
  Top Layer w0.254: 89.08,6.8 89.06,6.82 89.06,7.42 v1(88.69,7.8)
  Bottom Layer w0.254: 69.87,8.57 70.55,7.89 73.93,7.88 74.08,7.74 75.03,7.74 75.18,7.88 88.6,7.88 v1(88.69,7.8) ; 69.74,9.76 68.41,11.09 48.24,11.09 47.54,10.39 47.54,9.31
PWR_VCC: length 25.2
  Top Layer w0.254: 26.47,13.8 32.01,19.34 32.01,19.34 32.19,19.52 32.19,23.23 31.91,23.51
  Top Layer w1: 13.9,16.48 13.96,16.43 22.99,16.43 25.55,13.87
  Top Layer w1.2: 25.6,13.92 25.76,13.76
SCK: length 46.6
  Top Layer w0.254: 90.53,6.42 90.53,6.05 89.67,5.2 77.89,5.2 74.23,8.86 72.62,8.86 ; 72.12,9.18 71.8,9.18 70.24,10.73 64.41,10.73 63.35,9.68 63.35,8.08 62.9,7.62 50.57,7.62 49.16,9.03
V_C1: length 4.3
  Top Layer w0.254: 40.24,32.32 40.24,35.95 40.7,36.41
V_C2: length 4.4
  Top Layer w0.254: 43.35,32.29 43.35,36.43 43.16,36.62
V_C3: length 4.9
  Top Layer w0.254: 45.46,36.94 46.23,36.17 46.23,32.34
V_C4: length 4.4
  Top Layer w0.254: 48,36.89 48.74,36.15 48.74,32.84
VSYS: length 66.1
  Top Layer w0.254: 102.84,26.87 100.61,29.1 100.58,29.1 100.41,28.93 ; 67.96,27.01 68.01,26.96 68.01,21.45
  Top Layer w0.7: 94.83,35.18 95.34,34.67 95.34,32.35 ; 94.86,35.21 101.69,35.21 102.84,34.06 102.84,23.87 102.97,23.75 ; 68.08,27.87 68.08,31.31 72.13,35.35 94.69,35.35 ; 63.12,27.43 63.35,27.21 66.54,27.21
$1N3095: length 2.5
  Top Layer w0.254: 90.19,32.73 90.11,32.66 90.11,30.3
$1N3333: length 3.8
  Top Layer w0.254: 75.35,21.87 75.35,18.07 75.37,18.04
$1N3491: length 2.5
  Top Layer w0.254: 87.16,32.65 87.14,32.63 87.14,30.24 87.19,30.2
$1N7879: length 14.6
  Top Layer w0.254: 15.81,26.78 15.81,23.51 12.3,19.99 12.3,17.72 12.14,17.57 ; 20.44,27.91 16.62,27.91 16.59,27.94

## Copper pours and planes (outline as drawn; the poured copper is in the pictures)
GND on Top Layer: 94.68,18.6 98.43,18.6 98.43,14.86 94.68,14.86
GND on Top Layer: 38.24,16.35 40.26,16.35 40.26,14.25 38.24,14.25
GND on Top Layer: 4.36,10.85 16.18,10.85 16.18,1.48 4.36,1.48
GND on Top Layer: -0.02,39.92 105.6,39.92 105.6,0.03 -0.02,0.03
GND on Top Layer: 19.11,15.52 23.21,15.52 23.21,11.42 19.11,11.42
GND on Bottom Layer: 0.04,40.02 105.65,40.02 105.65,0.01 0.04,0.01
CHIP_PU on Top Layer: 96.32,33.62 101.66,33.62 101.66,29.99 96.32,29.99

## Text on the board
Top Layer: Mover cables spi mas al medio | 100x 58 max | agujeros
Top Silkscreen Layer: ATHENA-X 1.0
